# EasyEDA Pro project LinTOS_2026-10-19.epro, board PCB1_1
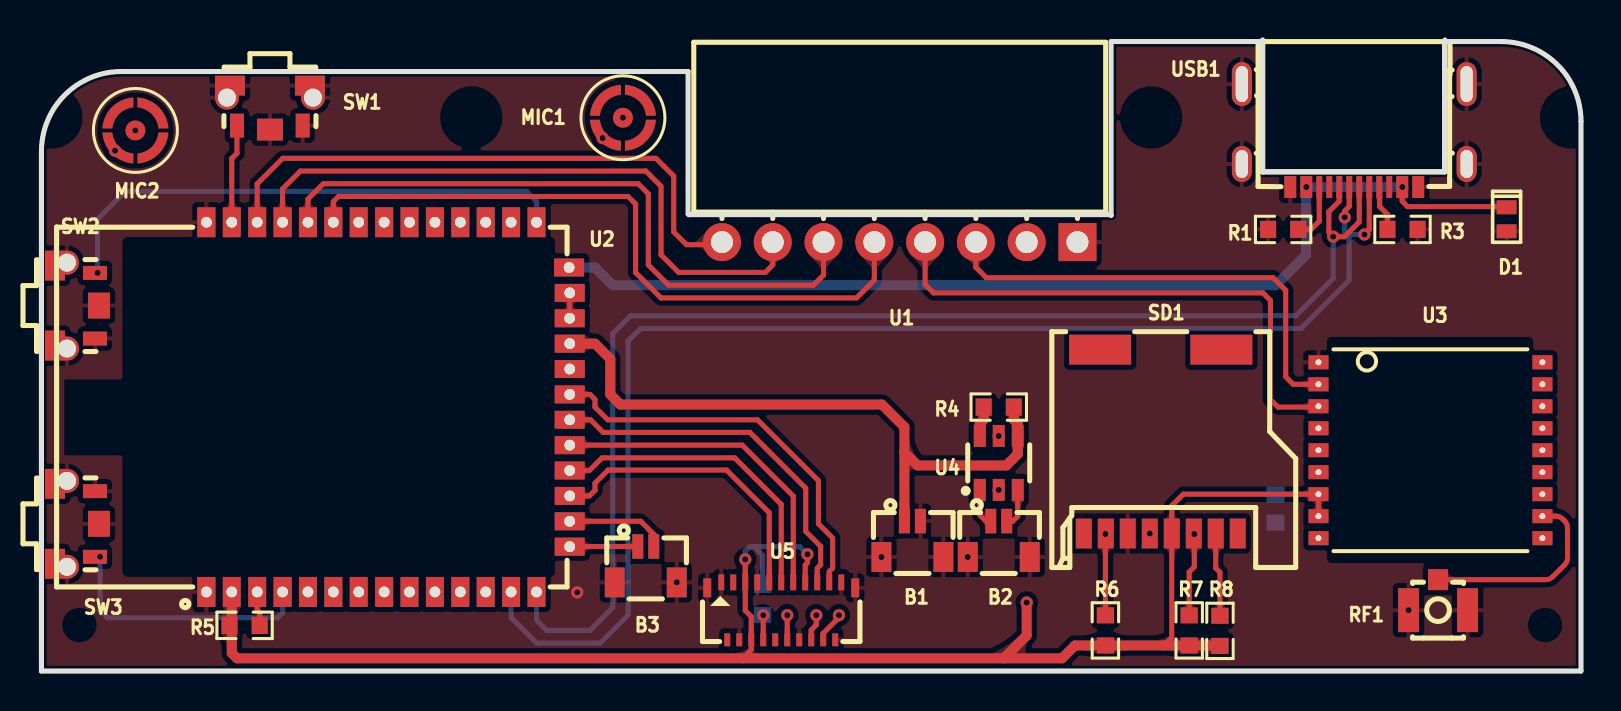
[diagram p4: board, top side]
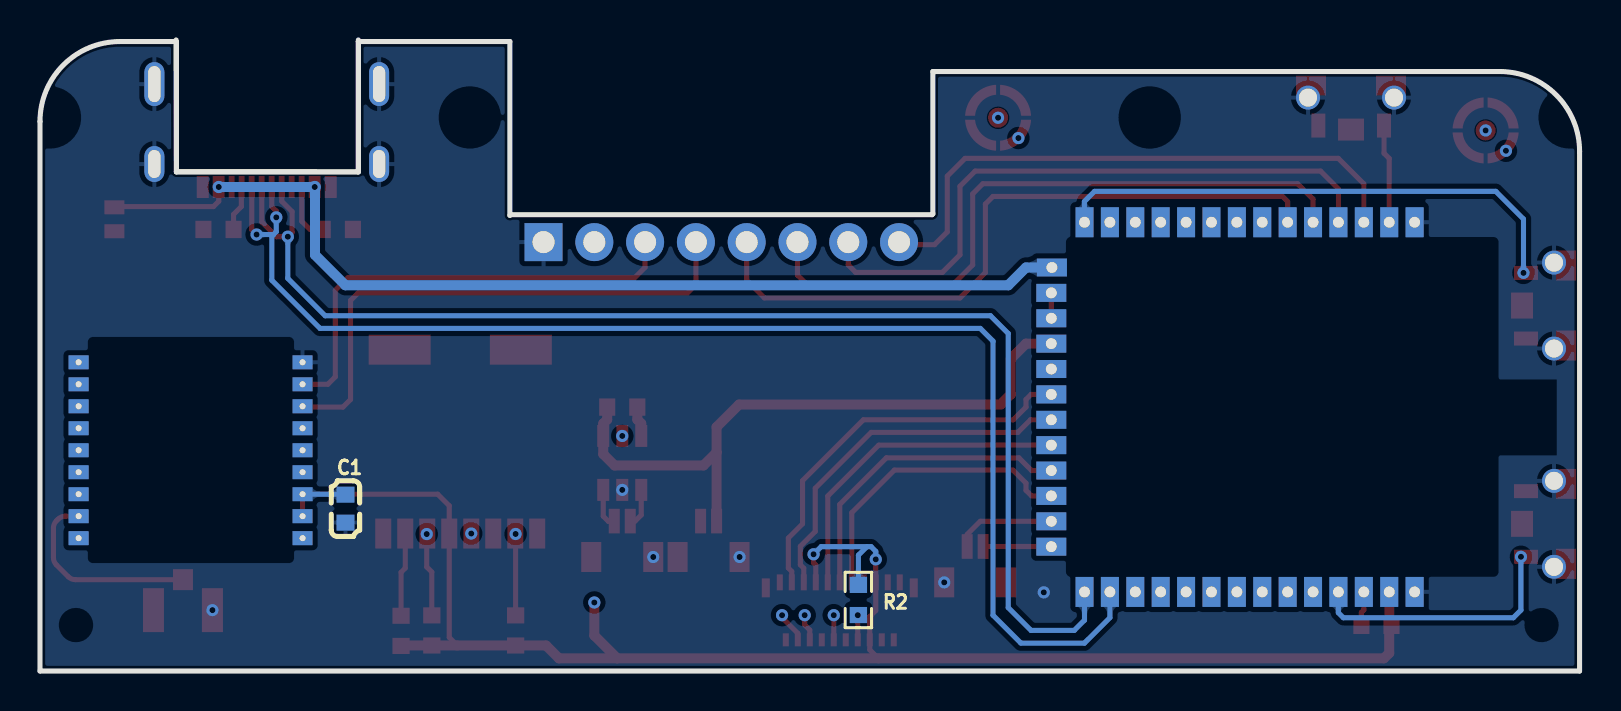
[diagram p5: board, bottom side, seen from below]

Outline 77 x 31.58 mm; copper layers: Top Layer, Inner1, Inner2, Bottom Layer. Coordinates in mm from the lower left corner of the outline.
Outline path: 0,26 arc(1.17,28.83) 4,30 32.34,30 32.34,22.88 32.38,22.84 53.47,22.84 53.5,22.8 53.5,31.5 61.07,31.5 61.08,31.5 61.08,24.98 70.17,24.98 70.18,24.98 70.18,31.48 70.2,31.5 73,31.5 arc(75.83,30.33) 77,27.5 77,0 0,0 0,26
Stack: Top Layer 0.035mm Outer layer thickness 1oz / Dielectric1 0.2104mm 7628 RC49% 8.6mil / Inner1 0.0152mm Inner layer thickness / Dielectric2 1.065mm 1.1mm H/HOZ Copper / Inner2 0.0152mm Inner layer thickness / Dielectric3 0.2104mm 7628 RC49% 8.6mil / Bottom Layer 0.035mm Outer layer thickness 1oz

## Design rules (mm)
spacing copperThickness1oz (default): track to track 0.102, other pairs 0.152 to 0.3
spacing copperThickness2oz: track to track 0.203, other pairs 0.152 to 0.3
track width copperThickness1oz (default): min 0.127, default 0.254, max 2.54
track width copperThickness2oz: min 0.203, default 0.254, max 2.54
differential pair differentialPair (default): width min 0.127, default 0.254, max 2.54; gap min 0.152, default 0.152
net GND uses copperRegion

## Placement (name value [footprint] x y rotation side)
B1  HC-0.8-2PWT  [CONN-SMD_2P-P0.80_HCTL_HC-0.8-2PWT]  43.56 6.6 0 top
B2  HC-0.8-2PWT  [CONN-SMD_2P-P0.80_HCTL_HC-0.8-2PWT]  47.88 6.6 0 top
B3  HC-0.8-2PWT  [CONN-SMD_2P-P0.80_HCTL_HC-0.8-2PWT]  30.23 5.33 0 top
C1  100nF  [C0603]  61.72 8.13 270 bottom
D1  LTVS16H5.0ET5G  [DFN1610-2L_L1.6-W1.0-P1.10-RD]  73.28 22.61 270 top
MIC1  MIC-4013-G-G00  [MIC-SMD_BD4.0-4013_SMDA]  29.08 27.69 0 top
MIC2  MIC-4013-G-G00  [MIC-SMD_BD4.0-4013_SMDA]  4.7 27.05 0 top
R1  5.1kΩ  [R0603]  62.1 22.1 0 top
R2  10kΩ  [R0603]  36.07 3.56 90 bottom
R3  5.1kΩ  [R0603]  68.07 22.1 180 top
R4  10kΩ  [R0603]  47.88 13.21 0 top
R5  10kΩ  [R0603]  10.16 2.29 0 top
R6  10kΩ  [R0603]  53.21 2.03 90 top
R7  10kΩ  [R0603]  57.4 2.03 90 top
R8  10kΩ  [R0603]  58.94 2.01 90 top
RF1  6GHz  [IPEX-SMD_BWIPX-1-001E]  69.85 3.81 270 top
SD1  TFS10-00S1-2000-A  [SIM-SMD_TFS10-00S1-2000-A]  55.98 11.48 0 top
SW1  TS-1010A-B  [SW-SMD_TS-1010A-B]  11.43 28.19 90 top
SW2  TS-1010A-B  [SW-SMD_TS-1010A-B]  1.78 18.29 180 top
SW3  TS-1010A-B  [SW-SMD_TS-1010A-B]  1.78 7.37 180 top
U1  PM254-1-08-W-8.5  [HDR-TH_8P-P2.54-H-F-W10.0-N]  42.93 21.46 180 top
U2  -  [ESP32-S3-AI-2E]  17.14 13.21 90 top
U3  MAX-M10S-00B  [SMD-18_L10.1-W9.7-P1.10-TL_SKG09F]  69.47 11.05 0 top
U4  TM6604  [SOT-23-6_L2.9-W1.6-P0.95-LS2.8-BR]  47.88 10.41 270 top
U5  FH35C-21S-0.3SHW(50)  [FPC-SMD_21P-P0.30_FH35C-21S-0.3SHW-50]  37 3 180 top
USB1  TYPEC-302-BRP16SC16  [USB-C-SMD_TYPEC-302-BRP16SC16]  65.66 26.8 180 top

## Footprints (pads in the part's own frame, mm; a bottom-side part is the same pattern mirrored in y, then rotated)
C0603
  rect 0.8x0.9 smd: 1(-0.7,0) 2(0.7,0)
CONN-SMD_2P-P0.80_HCTL_HC-0.8-2PWT
  rect 0.55x1.23 smd: 1(-0.4,0.898) 2(0.4,0.898)
  rect 1x1.5 smd: 3(1.55,-0.898) 4(-1.55,-0.898)
DFN1610-2L_L1.6-W1.0-P1.10-RD
  rect 0.7x1 smd: 1(-0.6,0) 2(0.6,0)
ESP32-S3-AI-2E
  rect 1.5x0.9 hole 0.54: 1(-9.25,8.895) 2(-9.25,7.625) 3(-9.25,6.355) 4(-9.25,5.085) 5(-9.25,3.815) 6(-9.25,2.545) 7(-9.25,1.275) 8(-9.25,0.005) 9(-9.25,-1.265) 10(-9.25,-2.535) 11(-9.25,-3.805) 12(-9.25,-5.075) 13(-9.25,-6.345) 14(-9.25,-7.615) 27(9.25,-7.615) 28(9.25,-6.345) 29(9.25,-5.075) 30(9.25,-3.805) 31(9.25,-2.535) 32(9.25,-1.265) 33(9.25,0.005) 34(9.25,1.275) 35(9.25,2.545) 36(9.25,3.815) 37(9.25,5.085) 38(9.25,6.355) 39(9.25,7.625) 40(9.25,8.895)
  rect 0.9x1.5 hole 0.54: 15(-6.985,-9.276) 16(-5.715,-9.276) 17(-4.445,-9.276) 18(-3.175,-9.276) 19(-1.905,-9.276) 20(-0.635,-9.276) 21(0.635,-9.276) 22(1.905,-9.276) 23(3.175,-9.276) 24(4.445,-9.276) 25(5.715,-9.276) 26(6.985,-9.246)
FPC-SMD_21P-P0.30_FH35C-21S-0.3SHW-50
  rect 0.3x0.8 smd: 1(3,-1.438) 3(2.4,-1.438) 5(1.8,-1.438) 7(1.2,-1.438) 9(0.6,-1.438) 11(0,-1.438) 13(-0.6,-1.438) 15(-1.2,-1.438) 17(-1.8,-1.438) 19(-2.4,-1.438) 21(-3,-1.438)
  rect 0.3x0.65 smd: 2(2.7,1.438) 4(2.1,1.438) 6(1.5,1.438) 8(0.9,1.438) 10(0.3,1.438) 12(-0.3,1.438) 14(-0.9,1.438) 16(-1.5,1.438) 18(-2.1,1.438) 20(-2.7,1.438)
  rect 0.4x0.95 smd: 22(-3.7,-1.163) 23(3.7,-1.163)
HDR-TH_8P-P2.54-H-F-W10.0-N
  rect 1.9x1.9 hole 1.1: 1(-8.89,0)
  round 1.9 hole 1.1: 2(-6.35,0) 3(-3.81,0) 4(-1.27,0) 5(1.27,0) 6(3.81,0) 7(6.35,0) 8(8.89,0)
IPEX-SMD_BWIPX-1-001E
  rect 1.05x1 smd: 1(-0.762,0)
  rect 2.2x1.05 smd: 2(0.762,-1.475) 3(0.762,1.475)
MIC-SMD_BD4.0-4013_SMDA
  round 1 smd: 1(0,0)
  custom 1.55x1.55 smd: 2(-1.079,-0.875) 2(-0.875,1.079) 2(0.875,-1.079) 2(1.079,0.875)
R0603
  rect 0.806x0.864 smd: 1(-0.753,0) 2(0.753,0)
SIM-SMD_TFS10-00S1-2000-A
  rect 0.8x1.5 smd: 1(3.85,-4.6) 2(2.75,-4.6) 3(1.65,-4.6) 4(0.55,-4.6) 5(-0.55,-4.6) 6(-1.65,-4.6) 7(-2.75,-4.6) 8(-3.85,-4.6)
  rect 3.1x1.5 smd: 9(-3.03,4.6) 10(3.03,4.6)
SMD-18_L10.1-W9.7-P1.10-TL_SKG09F
  rect 1x0.7 hole 0.3: 1(-5.6,4.4) 2(-5.6,3.3) 3(-5.6,2.2) 4(-5.6,1.1) 5(-5.6,0) 6(-5.6,-1.1) 7(-5.6,-2.2) 8(-5.6,-3.3) 9(-5.6,-4.4) 10(5.6,-4.4) 11(5.6,-3.3) 12(5.6,-2.2) 13(5.6,-1.1) 14(5.6,0) 15(5.6,1.1) 16(5.6,2.2) 17(5.6,3.3) 18(5.6,4.4)
SOT-23-6_L2.9-W1.6-P0.95-LS2.8-BR
  rect 1.1x0.6 smd: 1(1.35,-0.95) 2(1.35,0) 3(1.35,0.95) 4(-1.35,0.95) 5(-1.35,0) 6(-1.35,-0.95)
SW-SMD_TS-1010A-B
  rect 1.2x0.7 smd: 1(-0.9,1.65) 2(-0.9,-1.635)
  rect 1.1x1.3 smd: 3(-1.1,0)
  round 1.2 hole 0.9: 4(0.5,2.15) 5(0.5,-2.15)
  rect 1x1.5 smd: 4(1.1,2) 5(1.1,-2)
USB-C-SMD_TYPEC-302-BRP16SC16
  rect 0.6x1.1 smd: 1(-3.2,2.575) 2(-2.4,2.575) 11(2.4,2.575) 12(3.2,2.575)
  rect 0.3x1.1 smd: 3(-1.75,2.575) 4(-1.25,2.575) 5(-0.75,2.575) 6(-0.25,2.575) 7(0.25,2.575) 8(0.75,2.575) 9(1.25,2.575) 10(1.75,2.575)
  oval 1x1.8 hole 0.61x1.4: 13(-5.62,1.425) 14(5.62,1.425)
  oval 1x2.2 hole 0.61x1.8: 15(-5.62,-2.575) 16(5.62,-2.575)

## Nets
As in the schematic.

Pads without a net: SD1 1 8 9 10; U2 28 29; U3 4 6 9 10 12 13 14 15 16 17 18; U5 2 3 10; USB1 3 9

## Via types
v1: diameter 0.61, hole 0.305, Top Layer to Bottom Layer, 28 vias

## Routing (per net, layer and track width the routed paths; a pad name or vN(x,y) marks a point on that pad's centre or on a via; arc(x,y) is an arc through that point)
+5V: length 52
  Top Layer w0.254: 73.19,23.24 68.33,23.24 68.06,23.51 v1(68.06,24.22)
  Bottom Layer w0.5: v1(68.06,24.22) v1(63.26,24.22) 63.25,24.21 63.25,20.83 61.72,19.3 28.57,19.3 27.69,20.19 U2.26
GND:
  vias: v1(26.8,3.94) v1(31.78,4.44) v1(42.01,5.71) v1(46.33,5.71) v1(47.88,9.06) v1(68.38,3.05)
VBAT: length 32.8
  Top Layer w0.5: B1.1 43.16,10.94 ; 43.16,10.94 43.81,10.29 48.26,10.29 48.83,10.86 U4.4 48.83,12.39 48.63,12.58 R4.2 ; 43.16,10.94 43.16,12.21 42.04,13.33 28.96,13.33 28.45,13.84 28.45,15.62 27.69,16.38 U2.23
VCC3V3: length 104.7
  Top Layer w0.254: 56.13,1.28 56.53,1.68 SD1.4 56.53,8.27 57.11,8.85 U3.7 63.87,7.75 ; v1(38.31,5.84) 38.31,5.42 38.2,5.31 U5.15 ; 35.07,0.64 35.5,1.06 U5.6 35.5,2.73 35.2,3.03 U5.5 v1(35.2,5.59)
  Top Layer w0.5: R8.1 58.92,1.28 R7.1 R6.1 51.69,1.28 51.05,0.64 48.13,0.64 ; v1(49.28,3.43) 49.28,1.78 48.13,0.64 ; U2.2 9.52,0.9 9.78,0.64 48.13,0.64
  Inner2 w0.5: v1(49.28,3.43) U1.2
  Bottom Layer w0.254: 35.64,6.22 36.07,5.8 R2.2 ; 35.64,6.22 35.43,6.22 35.2,5.99 v1(35.2,5.59) ; 35.64,6.22 37.93,6.22 v1(38.31,5.84) ; C1.1 61.74,8.85 U3.7
GPIO0: length 26.5
  Bottom Layer w0.254: U2.27 24.76,22.46 24.76,23.5 24.26,24 4.19,24 2.81,22.62 v1(2.81,19.92)
GPIO1: length 4.8
  Top Layer w0.254: U2.39 9.52,25.65 9.78,25.91 9.78,27.17
GPIO2: length 29.2
  Top Layer w0.254: U1.8 33.91,21.34 32.26,21.34 31.62,21.97 31.62,24.77 30.73,25.65 12.06,25.65 10.79,24.38 U2.38
GPIO4: length 13.1
  Bottom Layer w0.254: U2.4 12.06,3.95 12.06,2.92 11.81,2.67 3.31,2.67 2.93,3.05 v1(2.93,5.72)
GPIO5: length 31.8
  Top Layer w0.254: U5.18 39.1,1.89 39.89,2.68 v1(39.89,2.79)
  Inner1 w0.254: v1(39.89,2.79) 39.89,1.91 38.74,0.76 14.73,0.76 13.33,2.16 13.33,3.95 U2.5
GPIO6: length 28.2
  Top Layer w0.254: U5.16 38.5,2.05 38.75,2.31 v1(38.75,2.79)
  Inner1 w0.254: U2.6 14.6,2.42 15.62,1.4 37.72,1.4 38.75,2.43 v1(38.75,2.79)
GPIO7: length 24.8
  Top Layer w0.254: U5.12 v1(37.3,2.79)
  Inner1 w0.254: v1(37.3,2.79) 37.3,2.38 36.96,2.03 16.51,2.03 15.87,2.67 U2.7
GPIO8: length 34.7
  Inner2 w0.254: U2.12 22.22,3.05 22.48,2.79 34.42,2.79 35.05,3.43 46.61,3.43 47.24,4.06 47.24,11.43 47.58,11.76 v1(47.88,11.76)
GPIO9: length 15.1
  Top Layer w0.254: U2.17 27.41,8.76 27.69,9.04 27.69,9.4 28.34,10.06 34.27,10.06 36.4,7.92 U5.9
GPIO10: length 15.7
  Top Layer w0.254: U2.18 27.41,10.03 28.04,10.67 34.67,10.67 37,8.34 U5.11
GPIO11: length 16.6
  Top Layer w0.254: U5.13 37.6,8.75 35.05,11.3 U2.19
GPIO12: length 18.3
  Top Layer w0.254: U5.17 38.8,5.15 38.97,5.32 38.97,6.24 38.23,6.98 38.23,9.14 35.43,11.94 28.09,11.94 27.46,12.57 U2.20
GPIO13: length 19.9
  Top Layer w0.254: U2.21 27.43,13.84 27.69,13.59 27.69,13.21 28.32,12.57 35.81,12.57 38.86,9.53 38.86,7.37 39.57,6.66 39.57,5.15 39.4,4.98 U5.19
GPIO15: length 53.8
  Top Layer w0.254: R7.2 57.4,4.95 57.66,5.21 v1(57.66,6.85) SD1.3
  Inner2 w0.254: v1(57.66,6.85) 57.66,1.02 57.15,0.51 17.91,0.51 17.14,1.28 U2.8
GPIO16: length 44.8
  Inner2 w0.254: v1(55.43,6.88) 55.43,1.84 54.61,1.02 19.3,1.02 18.41,1.91 U2.9
GPIO17: length 44.1
  Top Layer w0.254: R6.2 v1(53.21,6.86)
  Inner2 w0.254: U2.10 19.68,2.55 20.57,1.65 52.32,1.65 53.21,2.54 v1(53.21,6.86)
GPIO18: length 52.1
  Inner2 w0.254: U3.5 52.71,11.05 51.69,10.03 51.69,3.3 50.6,2.21 21.2,2.21 20.95,2.46 U2.11
GPIO19: length 67.5
  Top Layer w0.254: USB1.7 65.41,23.25 65.18,23.02 v1(65.18,22.7) ; v1(66.17,21.84) 66.41,22.09 USB1.5
  Bottom Layer w0.254: 65.32,21.84 65.41,21.76 65.41,19.56 62.99,17.14 29.97,17.14 29.34,16.51 29.34,2.79 27.94,1.4 24.76,1.4 23.49,2.67 U2.13 ; 65.32,21.84 65.18,21.98 v1(65.18,22.7) ; 65.32,21.84 v1(66.17,21.84)
GPIO20: length 65
  Top Layer w0.254: USB1.8 64.91,23.51 64.39,22.99 64.39,21.95 v1(64.61,21.73) 65.17,21.73 65.91,22.47 USB1.6
  Bottom Layer w0.254: U2.14 24.76,2.55 25.27,2.03 27.43,2.03 28.57,3.17 28.57,16.89 29.46,17.78 62.74,17.78 64.61,19.65 v1(64.61,21.73)
GPIO42: length 34.6
  Top Layer w0.254: U2.35 14.6,23.49 14.86,23.75 29.34,23.75 29.72,23.37 29.72,19.94 30.99,18.67 40.77,18.67 41.66,19.56 U1.5
GPIO43: length 32
  Top Layer w0.254: U2.37 12.06,24.12 12.95,25.02 30.23,25.02 30.99,24.26 30.99,20.83 31.87,19.95 36.2,19.95 36.58,20.32 U1.7
GPIO44: length 33.3
  Top Layer w0.254: U1.6 39.12,19.81 38.61,19.3 31.37,19.3 30.35,20.32 30.35,23.88 29.84,24.38 14.1,24.38 13.33,23.62 U2.36
LCD_RESET: length 1.2
  Top Layer w0.254: U5.8 v1(36.1,2.79)
U0RXD: length 48.9
  Top Layer w0.254: U1.3 46.74,20.2 47.25,19.69 61.59,19.69 62.23,19.05 62.23,14.72 62.6,14.35 63.87,14.35 U3.2
  Inner2 w0.254: U1.3 46.74,17.89 45.99,17.14 29.08,17.14 28.7,16.76 28.7,15.88 27.94,15.11 U2.22
U0TXD: length 66.2
  Top Layer w0.254: U1.4 44.2,19.34 44.62,18.92 61.09,18.92 61.47,18.54 61.47,13.59 61.85,13.21 63.83,13.21 63.87,13.25
  Inner2 w0.254: U2.34 15.87,23.87 16.13,24.13 28.07,24.13 28.7,23.5 28.7,18.16 29.08,17.78 43.69,17.78 44.2,18.29 U1.4
$1N229: length 2
  Top Layer w0.254: U4.3 48.83,7.75 48.57,7.49 48.29,7.49 B2.2
$1N390: length 2.3
  Top Layer w0.254: USB1.4 66.93,24.2 66.93,23.24 67.32,22.85 R3.2
$1N401: length 10.1
  Top Layer w0.254: RF1.1 75.23,4.57 arc(75.42,4.61) 75.59,4.72 76.18,5.31 arc(76.29,5.48) 76.33,5.67 76.33,7.16 arc(76.29,7.35) 76.18,7.51 76.09,7.6 arc(75.93,7.71) 75.74,7.75 75.07,7.75
$1N406: length 3.4
  Top Layer w0.254: B3.1 26.43,6.23 U2.15
$1N487: length 1.9
  Top Layer w0.254: U4.1 46.93,7.81 47.24,7.5 47.48,7.5
$1N559: length 3.2
  Top Layer w0.254: 62.6,22.1 63.5,22.1 63.91,22.51 USB1.10
$1N564: length 1.7
  Top Layer w0.254: R5.2 10.91,2.93 10.79,3.05 U2.3
$1N576: length 5.1
  Top Layer w0.254: B3.2 30.63,6.84 29.97,7.49 U2.16
$1N584: length 1.3
  Top Layer w0.254: U2.25 U2.24
$1N623: length 1.5
  Top Layer w0.5: R4.1 47.13,12.58 46.93,12.39 U4.6
$1N628: length 11.9
  Inner1 w0.254: v1(28.07,26.67) 28.07,25.91 27.56,25.4 20.32,25.4 19.68,24.76 U2.31
$1N629: length 12.7
  Inner1 w0.254: v1(29.08,27.69) 29.08,25.4 28.45,24.77 21.46,24.77 20.95,24.25 U2.30
$1N646: length 4.2
  Top Layer w0.254: SD1.2 58.73,5.15 58.94,4.94 R8.2
$1N654: length 17.6
  Inner1 w0.254: v1(4.7,27.05) 4.7,25.65 4.95,25.4 17.53,25.4 18.41,24.52 U2.32
$1N655: length 16.4
  Inner1 w0.254: v1(3.68,26.03) 3.68,25.02 4.06,24.64 16.51,24.64 17.14,24.01 U2.33

## Copper pours and planes (outline as drawn; the poured copper is in the pictures)
GND on Top Layer: 0,31.62 77.22,31.62 77.22,0 0,0
GND on Bottom Layer: 0,31.37 77.09,31.37 77.09,0 0,0

Small or netless copper shapes (teardrops, artwork), in the pictures only: 100 on Top Layer, 18 on Bottom Layer, 14 on Inner1, 16 on Inner2
